# Altium project flight_controller_V1.PrjPcb
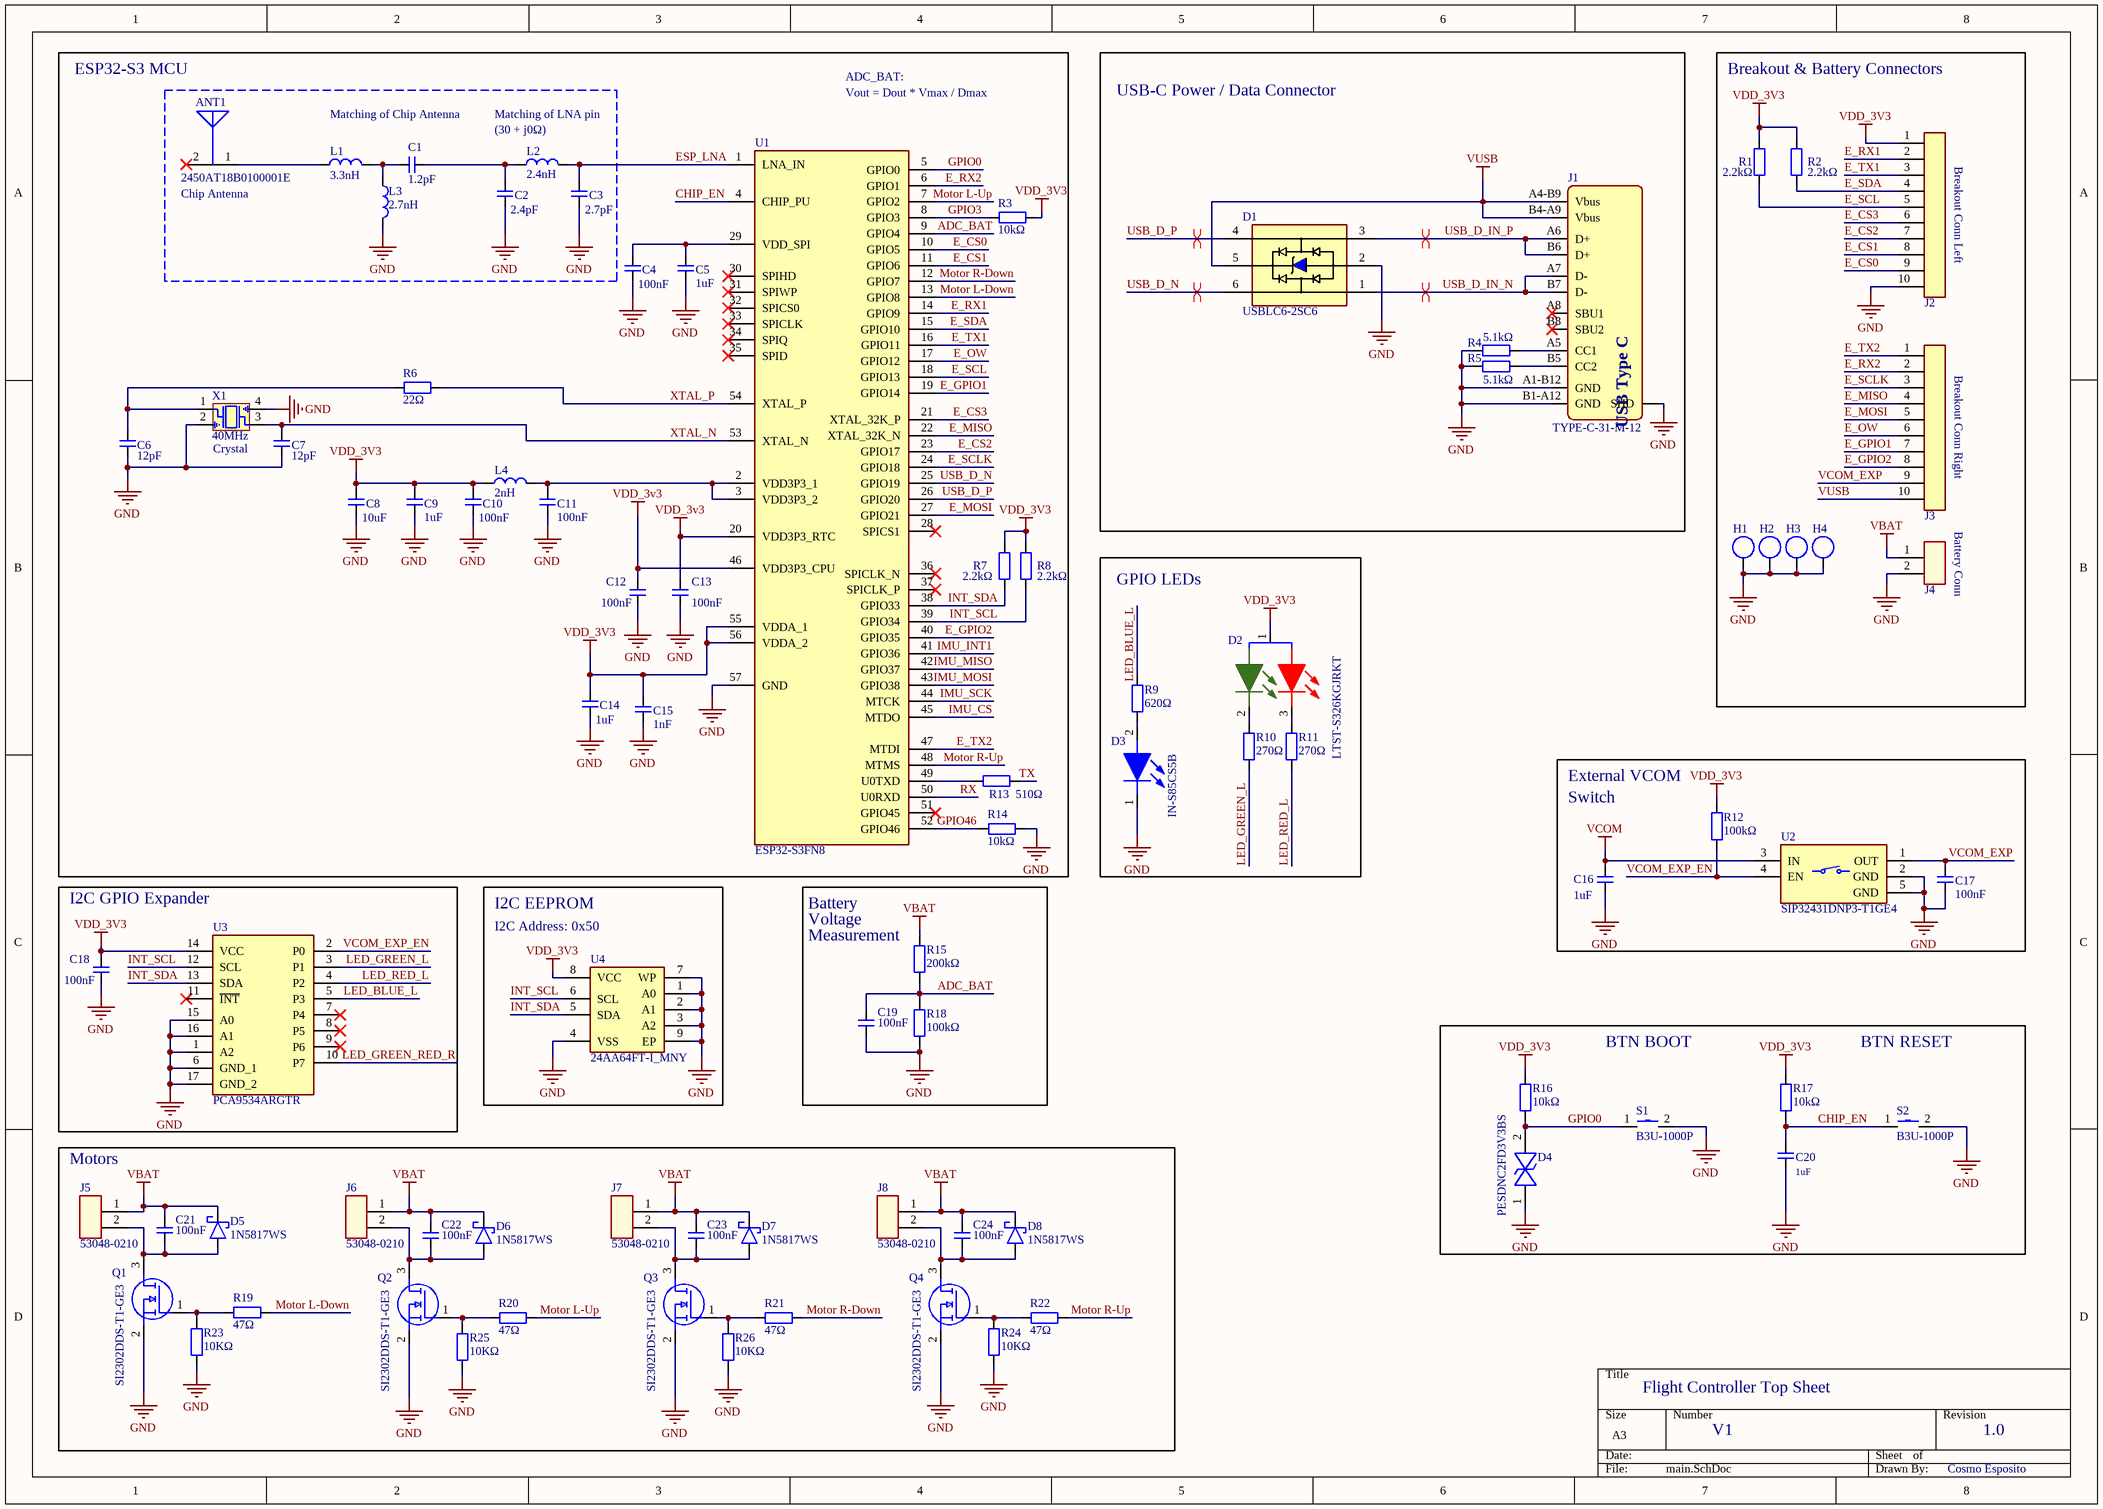
[diagram p0: main.SchDoc]
3 sheets, 115 parts. Net scope: global (net labels, ports and power ports of the same name join across sheets).
Board file: flight_controller.PcbDoc
Sheets:
  main.SchDoc
  sensors.SchDoc
  pm.SchDoc

## Sheet main.SchDoc: Flight Controller Top Sheet
size A3; SheetNumber: 1; SheetTotal: 3

### Parts
ANT1  2450AT18B0100001E  [ANTC3216X140N]
C1  1.2pF  [0402 (1005 metric) CAP IPC-7351 Level B SMD]
C2  2.4pF  [0402 (1005 metric) CAP IPC-7351 Level B SMD]
C3  2.7pF  [0402 (1005 metric) CAP IPC-7351 Level B SMD]
C4  100nF  [0402 (1005 metric) CAP IPC-7351 Level B SMD]
C5  1uF  [0402 (1005 metric) CAP IPC-7351 Level B SMD]
C6  12pF  [0402 (1005 metric) CAP IPC-7351 Level B SMD]
C7  12pF  [0402 (1005 metric) CAP IPC-7351 Level B SMD]
C8  10uF  [0402 (1005 metric) CAP IPC-7351 Level B SMD]
C9  1uF  [0402 (1005 metric) CAP IPC-7351 Level B SMD]
C10  100nF  [0402 (1005 metric) CAP IPC-7351 Level B SMD]
C11  100nF  [0402 (1005 metric) CAP IPC-7351 Level B SMD]
C12  100nF  [0402 (1005 metric) CAP IPC-7351 Level B SMD]
C13  100nF  [0402 (1005 metric) CAP IPC-7351 Level B SMD]
C14  1uF  [0402 (1005 metric) CAP IPC-7351 Level B SMD]
C15  1nF  [0402 (1005 metric) CAP IPC-7351 Level B SMD]
C16  1uF  [0402 (1005 metric) CAP IPC-7351 Level B SMD]
C17  100nF  [0402 (1005 metric) CAP IPC-7351 Level B SMD]
C18  100nF  [0402 (1005 metric) CAP IPC-7351 Level B SMD]
C19  100nF  [0402 (1005 metric) CAP IPC-7351 Level B SMD]
C20  1uF  [0402 (1005 metric) CAP IPC-7351 Level B SMD]
C21  100nF  [0402 (1005 metric) CAP IPC-7351 Level B SMD]
C22  100nF  [0402 (1005 metric) CAP IPC-7351 Level B SMD]
C23  100nF  [0402 (1005 metric) CAP IPC-7351 Level B SMD]
C24  100nF  [0402 (1005 metric) CAP IPC-7351 Level B SMD]
D1  USBLC6-2SC6  [USBLC6-2 SOT-666]
D2  LTST-S326KGJRKT  [LTST-S326KGJRKT]
D3  IN-S85CS5B  [INS85CS5B]
D4  PESDNC2FD3V3BS  [PESDNC2FD3V3BS]
D5  1N5817WS  [SOD2613X110N]
D6  1N5817WS  [SOD2613X110N]
D7  1N5817WS  [SOD2613X110N]
D8  1N5817WS  [SOD2613X110N]
H1  Mounting_Hole  [Plated_Hole]  (value not drawn)
H2  Mounting_Hole  [Plated_Hole]  (value not drawn)
H3  Mounting_Hole  [Plated_Hole]  (value not drawn)
H4  Mounting_Hole  [Plated_Hole]  (value not drawn)
J1  TYPE-C-31-M-12  [USB-C-31-M-12]
J2  1-2307813-0  [123078130]  (value not drawn)
J3  1-2307813-0  [123078130]  (value not drawn)
J4  Battery  [Batt_pads]  (value not drawn)
J5  53048-0210  [53048-0210]
J6  53048-0210  [53048-0210]
J7  53048-0210  [53048-0210]
J8  53048-0210  [53048-0210]
L1  3.3nH  [0402 (1005 metric) IND IPC-7351 Level B SMD_]
L2  2.4nH  [0402 (1005 metric) IND IPC-7351 Level B SMD_]
L3  2.7nH  [0402 (1005 metric) IND IPC-7351 Level B SMD_]
L4  2nH  [0402 (1005 metric) IND IPC-7351 Level B SMD_]
Q1  SI2302DDS-T1-GE3  [SOT95P237X112-3N]
Q2  SI2302DDS-T1-GE3  [SOT95P237X112-3N]
Q3  SI2302DDS-T1-GE3  [SOT95P237X112-3N]
Q4  SI2302DDS-T1-GE3  [SOT95P237X112-3N]
R1  2.2kΩ  [0402 (1005 metric) RES IPC-7351 Level B SMD]
R2  2.2kΩ  [0402 (1005 metric) RES IPC-7351 Level B SMD]
R3  10kΩ  [0402 (1005 metric) RES IPC-7351 Level B SMD]
R4  5.1kΩ  [0402 (1005 metric) RES IPC-7351 Level B SMD]
R5  5.1kΩ  [0402 (1005 metric) RES IPC-7351 Level B SMD]
R6  22Ω  [0402 (1005 metric) RES IPC-7351 Level B SMD]
R7  2.2kΩ  [0402 (1005 metric) RES IPC-7351 Level B SMD]
R8  2.2kΩ  [0402 (1005 metric) RES IPC-7351 Level B SMD]
R9  620Ω  [0402 (1005 metric) RES IPC-7351 Level B SMD]
R10  270Ω  [0402 (1005 metric) RES IPC-7351 Level B SMD]
R11  270Ω  [0402 (1005 metric) RES IPC-7351 Level B SMD]
R12  100kΩ  [0402 (1005 metric) RES IPC-7351 Level B SMD]
R13  510Ω  [0402 (1005 metric) RES IPC-7351 Level B SMD]
R14  10kΩ  [0402 (1005 metric) RES IPC-7351 Level B SMD]
R15  200kΩ  [0402 (1005 metric) RES IPC-7351 Level B SMD]
R16  10kΩ  [0402 (1005 metric) RES IPC-7351 Level B SMD]
R17  10kΩ  [0402 (1005 metric) RES IPC-7351 Level B SMD]
R18  100kΩ  [0402 (1005 metric) RES IPC-7351 Level B SMD]
R19  47Ω  [0402 (1005 metric) RES IPC-7351 Level B SMD]
R20  47Ω  [0402 (1005 metric) RES IPC-7351 Level B SMD]
R21  47Ω  [0402 (1005 metric) RES IPC-7351 Level B SMD]
R22  47Ω  [0402 (1005 metric) RES IPC-7351 Level B SMD]
R23  10KΩ  [0402 (1005 metric) RES IPC-7351 Level B SMD]
R24  10KΩ  [0402 (1005 metric) RES IPC-7351 Level B SMD]
R25  10KΩ  [0402 (1005 metric) RES IPC-7351 Level B SMD]
R26  10KΩ  [0402 (1005 metric) RES IPC-7351 Level B SMD]
S1  B3U-1000P  [B3U-1000P]
S2  B3U-1000P  [B3U-1000P]
U1  ESP32-S3FN8  [ESP32-S3FN8]
U2  SIP32431DNP3-T1GE4  [SON50P160X120X60-5N-D]
U3  PCA9534ARGTR  [QFN50P300X300X100-17N-D]
U4  24AA64FT-I_MNY  [SON50P300X200X80-9N-D]
X1  40MHz  [ECS4001037B2CKMTR]

### Blocks framed on the sheet
ESP32-S3 MCU: ANT1 C1-C15 L1-L4 R3 R6-R8 R13 R14 U1 X1
USB-C Power / Data Connector: D1 J1 R4 R5
Breakout & Battery Connectors: H1-H4 J2-J4 R1 R2
GPIO LEDs: D2 D3 R9-R11
I2C GPIO Expander: C18 U3
I2C EEPROM: U4
Motors: C21-C24 D5-D8 J5-J8 Q1-Q4 R19-R26

### Nets
GND: C2.1 C3.1 C4.1 C5.1 C6.2 C7.2 C8.1 C9.1 C10.1 C11.1 C12.1 C13.1 C14.1 C15.1 C16.1 C17.1 C18.1 C19.1 C20.1 D1.2(GND) D3.1(K) D4.1 H1.1 H2.1 H3.1 H4.1 J1.A1-B12(GND) J1.B1-A12(GND) J1.SHD J2.10 J4.2 L3.1 Q1.2(S) Q2.2(S) Q3.2(S) Q4.2(S) R4.1 R5.1 R14.2 R18.1 R23.1 R24.1 R25.1 R26.1 S1.2 S2.2 U1.57(GND) U2.2(GND) U2.5(GND) U3.1(A2) U3.6(GND_1) U3.15(A0) U3.16(A1) U3.17(GND_2) U4.1(A0) U4.2(A1) U4.3(A2) U4.4(VSS) U4.7(WP) U4.9(EP) X1.2(GND_1) X1.4(GND_2)
VBAT: C21.2 C22.2 C23.2 C24.2 D5.1(K) D6.1(K) D7.1(K) D8.1(K) J4.1 J5.1 J6.1 J7.1 J8.1 R15.2
VCOM: C16.2 U2.3(IN)
VDD_3V3: C8.2 C9.2 C10.2 C12.2 C13.2 C14.2 C15.2 C18.2 D2.1(A) J2.1 L4.1 R1.2 R2.2 R3.2 R7.2 R8.2 R12.2 R16.2 R17.2 U1.20(VDD3P3_RTC) U1.46(VDD3P3_CPU) U1.55(VDDA_1) U1.56(VDDA_2) U3.14(VCC) U4.8(VCC)
VUSB: D1.5(VBUS) J1.A4-B9(Vbus) J1.B4-A9(Vbus) J3.10
ADC_BAT: C19.2 R15.1 R18.2 U1.9(GPIO4)
CHIP_EN: C20.2 R17.1 S2.1 U1.4(CHIP_PU)
E_CS0: J2.9 U1.10(GPIO5)
E_CS1: J2.8 U1.11(GPIO6)
E_CS2: J2.7 U1.23(GPIO17)
E_CS3: J2.6 U1.21(XTAL_32K_P)
E_GPIO1: J3.7 U1.19(GPIO14)
E_GPIO2: J3.8 U1.40(GPIO35)
E_MISO: J3.4 U1.22(XTAL_32K_N)
E_MOSI: J3.5 U1.27(GPIO21)
E_OW: J3.6 U1.17(GPIO12)
E_RX1: J2.2 U1.14(GPIO9)
E_RX2: J3.2 U1.6(GPIO1)
E_SCL: J2.5 R1.1 U1.18(GPIO13)
E_SCLK: J3.3 U1.24(GPIO18)
E_SDA: J2.4 R2.1 U1.15(GPIO10)
E_TX1: J2.3 U1.16(GPIO11)
E_TX2: J3.1 U1.47(MTDI)
ESP_LNA: C3.2 L2.2 U1.1(LNA_IN)
GPIO0: D4.2 R16.1 S1.1 U1.5(GPIO0)
GPIO3: R3.1 U1.8(GPIO3)
GPIO46: R14.1 U1.52(GPIO46)
IMU_CS: U1.45(MTDO)
IMU_INT1: U1.41(GPIO36)
IMU_MISO: U1.42(GPIO37)
IMU_MOSI: U1.43(GPIO38)
IMU_SCK: U1.44(MTCK)
INT_SCL: R8.1 U1.39(GPIO34) U3.12(SCL) U4.6(SCL)
INT_SDA: R7.1 U1.38(GPIO33) U3.13(SDA) U4.5(SDA)
LED_BLUE_L: R9.2 U3.5(P3)
LED_GREEN_L: R10.1 U3.3(P1)
LED_GREEN_RED_R: U3.10(P7)
LED_RED_L: R11.1 U3.4(P2)
Motor L-Down: R19.2 U1.13(GPIO8)
Motor L-Up: R20.2 U1.7(GPIO2)
Motor R-Down: R21.2 U1.12(GPIO7)
Motor R-Up: R22.2 U1.48(MTMS)
RX: U1.50(U0RXD)
TX: R13.2
USB_D_IN_N: D1.1(I/O1_1) J1.A7(D-) J1.B7(D-)
USB_D_IN_P: D1.3(I/O2_1) J1.A6(D+) J1.B6(D+)
USB_D_N: D1.6(I/O1_2) U1.25(GPIO19)
USB_D_P: D1.4(I/O2_2) U1.26(GPIO20)
VCOM_EXP: C17.2 J3.9 U2.1(OUT)
VCOM_EXP_EN: R12.1 U2.4(EN) U3.2(P0)
XTAL_N: C7.1 U1.53(XTAL_N) X1.3(OUT/IN)
XTAL_P: R6.2 U1.54(XTAL_P)
NetANT1_1: ANT1.1(FEED) L1.2
NetC1_1: C1.1 C2.2 L2.1
NetC1_2: C1.2 L1.1 L3.2
NetC4_2: C4.2 C5.2 U1.29(VDD_SPI)
NetC6_1: C6.1 R6.1 X1.1(IN/OUT)
NetC11_2: C11.2 L4.2 U1.2(VDD3P3_1) U1.3(VDD3P3_2)
NetC21_1: C21.1 D5.2(A) J5.2 Q1.3(D)
NetC22_1: C22.1 D6.2(A) J6.2 Q2.3(D)
NetC23_1: C23.1 D7.2(A) J7.2 Q3.3(D)
NetC24_1: C24.1 D8.2(A) J8.2 Q4.3(D)
NetD2_2: D2.2(K) R10.2
NetD2_3: D2.3(K) R11.2
NetD3_2: D3.2(A) R9.1
NetJ1_A5: J1.A5(CC1) R4.2
NetJ1_B5: J1.B5(CC2) R5.2
NetQ1_1: Q1.1(G) R19.1 R23.2
NetQ2_1: Q2.1(G) R20.1 R25.2
NetQ3_1: Q3.1(G) R21.1 R26.2
NetQ4_1: Q4.1(G) R22.1 R24.2
NetR13_1: R13.1 U1.49(U0TXD)

Not connected (* = marked no-connect by the designer): ANT1 2(NC)*; J1 A8(SBU1)* B8(SBU2)*; U1 28(SPICS1)* 30(SPIHD)* 31(SPIWP)* 32(SPICS0)* 33(SPICLK)* 34(SPIQ)* 35(SPID)* 36(SPICLK_N)* 37(SPICLK_P)* 51(GPIO45)*; U3 7(P4)* 8(P5)* 9(P6)* 11(~{INT})*

### Layout directives
differential pair; differential pair class DIFF_USB: USB_D_IN_N, USB_D_IN_P, USB_D_N, USB_D_P

### Notes on the sheet
- ADC_BAT:
- Vout = Dout * Vmax / Dmax
- Matching of Chip Antenna
- (near L2) Matching of LNA pin
- (near L2) (30 + j0Ω)
- (near J2) Breakout Conn Left
- (near ANT1) Chip Antenna
- (near J3) Breakout Conn Right
- Crystal
- Battery Conn
- (near R12) External VCOM
- Switch
- Battery
- Voltage
- (near U4) I2C Address: 0x50
- (near R15) Measurement
- BTN BOOT
- BTN RESET
- Flight Controller Top Sheet
- V1
- 1.0
- Cosmo Esposito
- (in symbol TYPE-C-31-M-12) USB Type C

### Library data of the parts
ANT1 = 2450AT18B0100001E: RF ANTENNA Chip Solder Surface Mount ,2.4GHz ~ 2.5GHz ,2 W; Manufacturer_Name: JOHANSON TECHNOLOGY; Geometry.Height: 1.4mm; Mouser Part Number: *; Mouser Price/Stock: *; Manufacturer_Part_Number: 2450AT18B0100001E; Datasheet Link: https://www.johansontechnology.com/docs/3829/Antenna-2450AT18B0100001E-Rev5.0_uMmswfC.pdf
C1-C24 = Capacitor Type1
  C1: Value: 1.2pF
  C2: Value: 2.4pF
  C3: Value: 2.7pF
  C4 C10-C13 C17-C19 C21-C24: Value: 100nF
  C5 C9 C14 C16 C20: Value: 1uF
  C6 C7: Value: 12pF
  C8: Value: 10uF
  C15: Value: 1nF
D1 = USBLC6-2SC6: TVS Diode Array Uni-Directional USBLC6-2SC6 17V, SOT-23 6-Pin; Manufacturer_Name: STMicroelectronics; Geometry.Height: 1.45mm; Mouser Part Number: 511-USBLC6-2SC6; Mouser Price/Stock: https://www.mouser.co.uk/ProductDetail/STMicroelectronics/USBLC6-2SC6?qs=po45yt2pPpu%2FhNIlwQdTlg%3D%3D; Manufacturer_Part_Number: USBLC6-2SC6; Datasheet Link: https://www.st.com/resource/en/datasheet/usblc6-2.pdf
D2 = LTST-S326KGJRKT: Red / Green standard LED; Manufacturer_Name: Lite-On; Datasheet Link: http://optoelectronics.liteon.com/upload/download/DS22-2000-287/LTST-S326KGJRKT.pdf; Manufacturer_Part_Number: LTST-S326KGJRKT; Mouser Part Number: 859-LTST-S326KGJRKT; Mouser Price/Stock: https://www.mouser.co.uk/ProductDetail/Lite-On/LTST-S326KGJRKT?qs=sXYjIdLHthxXAK%252B5bY%252BGww%3D%3D; Arrow Part Number: LTST-S326KGJRKT; Arrow Price/Stock: https://www.arrow.com/en/products/ltst-s326kgjrkt/lite-on-technology.html?utm_currency=USD&region=nac
D3 = IN-S85CS5B: Standard LEDs - SMD Blue LED; Manufacturer_Name: Inolux; Geometry.Height: 0.7mm; Mouser Part Number: 743-IN-S85CS5B; Mouser Price/Stock: https://www.mouser.co.uk/ProductDetail/Inolux/IN-S85CS5B?qs=stqOd1AaK79rJ2RZKPoGSg%3D%3D; Manufacturer_Part_Number: IN-S85CS5B; Datasheet Link: https://www.inolux-corp.com/datasheet/SMDLED/Mono%20Color%20Side%20View/IN-S85CS5B_V1.0.pdf
D4 = PESDNC2FD3V3BS: Bottom ViewEM/CM/EMS Only; Manufacturer_Name: Prisemi; Geometry.Height: 0.498mm; Manufacturer_Part_Number: PESDNC2FD3V3BS; Mouser Part Number: *; Mouser Price/Stock: *; Arrow Part Number: *; Arrow Price/Stock: *; Datasheet Link: https://datasheet.lcsc.com/lcsc/2003172139_Shanghai-Prisemi-Elec-PESDNC2FD3V3BS_C496536.pdf
D5-D8 = 1N5817WS: Diode 20V 1A Surface Mount SOD-323; Manufacturer_Name: Guandong AK Semiconductor; Geometry.Height: 1.1mm; Manufacturer_Part_Number: 1N5817WS; Mouser Part Number: *; Mouser Price/Stock: *; Arrow Part Number: *; Arrow Price/Stock: *; Datasheet Link: https://atlas.eefcdn.com/partdatasheet/666677/666677_35638466_1757293714069.pdf
J1 = TYPE-C-31-M-12: Description; Manufacturer_Name: HRO Electronics; Copyright: Copyright (C) 2025 Ultra Librarian. All rights reserved.; Manufacturer_Part_Number: TYPE-C-31-M-12; RefDes: RefDes; Type: Type
J2 J3 = 1-2307813-0: Board to Board & Mezzanine Connectors 10P,2MM,BB,REC,SRVT,SMD,0.1AU,TR,W/CP
J4 = Battery_conn
J5-J8 = 53048-0210: 1.25mm Pitch, PicoBlade PCB Header, Single Row, Right-Angle, Surface Mount, Tin (Sn) Plating, Friction Lock, 2 Circuits, Natural, Tape and Reel; Manufacturer_Name: Molex Connector Corporation; Copyright: Copyright (C) 2025 Ultra Librarian. All rights reserved.; Manufacturer_Part_Number: 53048-0210; RefDes: RefDes; Type: Type
L1-L4 = Inductor Type1
  L1: Value: 3.3nH
  L2: Value: 2.4nH
  L3: Value: 2.7nH
  L4: Value: 2nH
Q1-Q4 = SI2302DDS-T1-GE3: SI2302DDS-T1-GE3 N-Channel MOSFET, 2.6 A, 20 V, 3-Pin SOT-363 Vishay; Geometry.Height: 1.12mm; Mouser Part Number: 78-SI2302DDS-T1-GE3; Mouser Price/Stock: https://www.mouser.co.uk/ProductDetail/Vishay-Semiconductors/SI2302DDS-T1-GE3?qs=MxnWX8BLHKdaCSNWhg%252BxLA%3D%3D; Manufacturer_Name: Vishay; Manufacturer_Part_Number: SI2302DDS-T1-GE3; Datasheet Link: http://www.vishay.com/docs/63653/si2302dds.pdf
R1-R26 = Resistor Type1
  R1 R2 R7 R8: Value: 2.2kΩ
  R3 R14 R16 R17: Value: 10kΩ
  R4 R5: Value: 5.1kΩ
  R6: Value: 22Ω
  R9: Value: 620Ω
  R10 R11: Value: 270Ω
  R12 R18: Value: 100kΩ
  R13: Value: 510Ω
  R15: Value: 200kΩ
  R19-R22: Value: 47Ω
  R23-R26: Value: 10KΩ
S1 S2 = B3U-1000P: Switch; Manufacturer_Name: OMRON Electronics; Datasheet Link: https://www.omron.com/ecb/products/pdf/en-b3u.pdf; Manufacturer_Part_Number: B3U-1000P; Mouser Part Number: 653-B3U-1000P; Mouser Price/Stock: https://www.mouser.co.uk/ProductDetail/Omron-Electronics/B3U-1000P?qs=AO7BQMcsEu4ip80xyf2FwA%3D%3D; Arrow Part Number: B3U-1000P; Arrow Price/Stock: https://www.arrow.com/en/products/b3u1000p/omron.html?utm_currency=USD&region=nac
U1 = ESP32-S3FN8: Espressif Systems [ENGINEERING SAMPLES]SMD IC , Dual-Core MCU, Wi-Fi 2.4G & BLE 5.0 combo, 8 MB Octal SPI PSRAM; Geometry.Height: 0.9mm; Manufacturer_Name: Espressif Systems; Manufacturer_Part_Number: ESP32-S3FN8; Mouser Part Number: 356-ESP32-S3FN8; Mouser Price/Stock: https://www.mouser.co.uk/ProductDetail/Espressif-Systems/ESP32-S3FN8?qs=Rp5uXu7WBW%2F4Oihh5tkiVQ%3D%3D; Arrow Part Number: *; Arrow Price/Stock: *; Datasheet Link: https://www.espressif.com/sites/default/files/documentation/esp32-s3_datasheet_en.pdf
U2 = SIP32431DNP3-T1GE4: Power Switch ICs - Power Distribution 1A Slew Rate Ctrl Load Switch; Manufacturer_Name: Vishay; Geometry.Height: 0.6mm; Manufacturer_Part_Number: SIP32431DNP3-T1GE4; Mouser Part Number: 781-SIP32431DNP3-GE4; Mouser Price/Stock: https://www.mouser.co.uk/ProductDetail/Vishay-Semiconductors/SIP32431DNP3-T1GE4?qs=FfLXECYddQQ0YorCqBSrEw%3D%3D; Arrow Part Number: SIP32431DNP3-T1GE4; Arrow Price/Stock: https://www.arrow.com/en/products/sip32431dnp3-t1ge4/vishay?utm_currency=USD&region=nac; Datasheet Link: https://www.vishay.com/docs/66597/sip32431.pdf
U3 = PCA9534ARGTR: Remote 8-Bit I2C and Low-Power I/O Expander With Interrupt Output and Configuration Registers; Manufacturer_Name: Texas Instruments; Geometry.Height: 1mm; Mouser Part Number: 595-PCA9534ARGTR; Mouser Price/Stock: https://www.mouser.co.uk/ProductDetail/Texas-Instruments/PCA9534ARGTR?qs=iSMark9AYDXZsmImREj9BA%3D%3D; Manufacturer_Part_Number: PCA9534ARGTR; Datasheet Link: http://www.ti.com/lit/ds/symlink/pca9534a.pdf
U4 = 24AA64FT-I_MNY: EEPROM 64K 8KX8 1.8V SER EE IND 1/4AWP RPO; Manufacturer_Name: Microchip; Manufacturer_Part_Number: 24AA64FT-I/MNY; Geometry.Height: 0.8mm; Mouser Part Number: 579-24AA64FT-I/MNY; Mouser Price/Stock: https://www.mouser.co.uk/ProductDetail/Microchip-Technology/24AA64FT-I-MNY?qs=WqWCsLCZBkpYIYo7OoCm1g%3D%3D; Datasheet Link: http://www.microchip.com/mymicrochip/filehandler.aspx?ddocname=en541451
X1 = ECS-400-10-37B2-CKM-TR: 40 MHz +/-10ppm Crystal 10pF 40 Ohms 4-SMD, No Lead , -20C ~ 70C; Manufacturer_Name: ECS; Geometry.Height: 0.5mm; Mouser Part Number: 520-400-10-37B2CKMTR; Mouser Price/Stock: https://www.mouser.co.uk/ProductDetail/ECS/ECS-400-10-37B2-CKM-TR?qs=QNEnbhJQKvYTTE6TC4Pr1w%3D%3D; Manufacturer_Part_Number: ECS-400-10-37B2-CKM-TR; Datasheet Link: https://ecsxtal.com/store/pdf/ECX-1637B2.pdf

## Sheet sensors.SchDoc
size A4; SheetNumber: 2; SheetTotal: 3
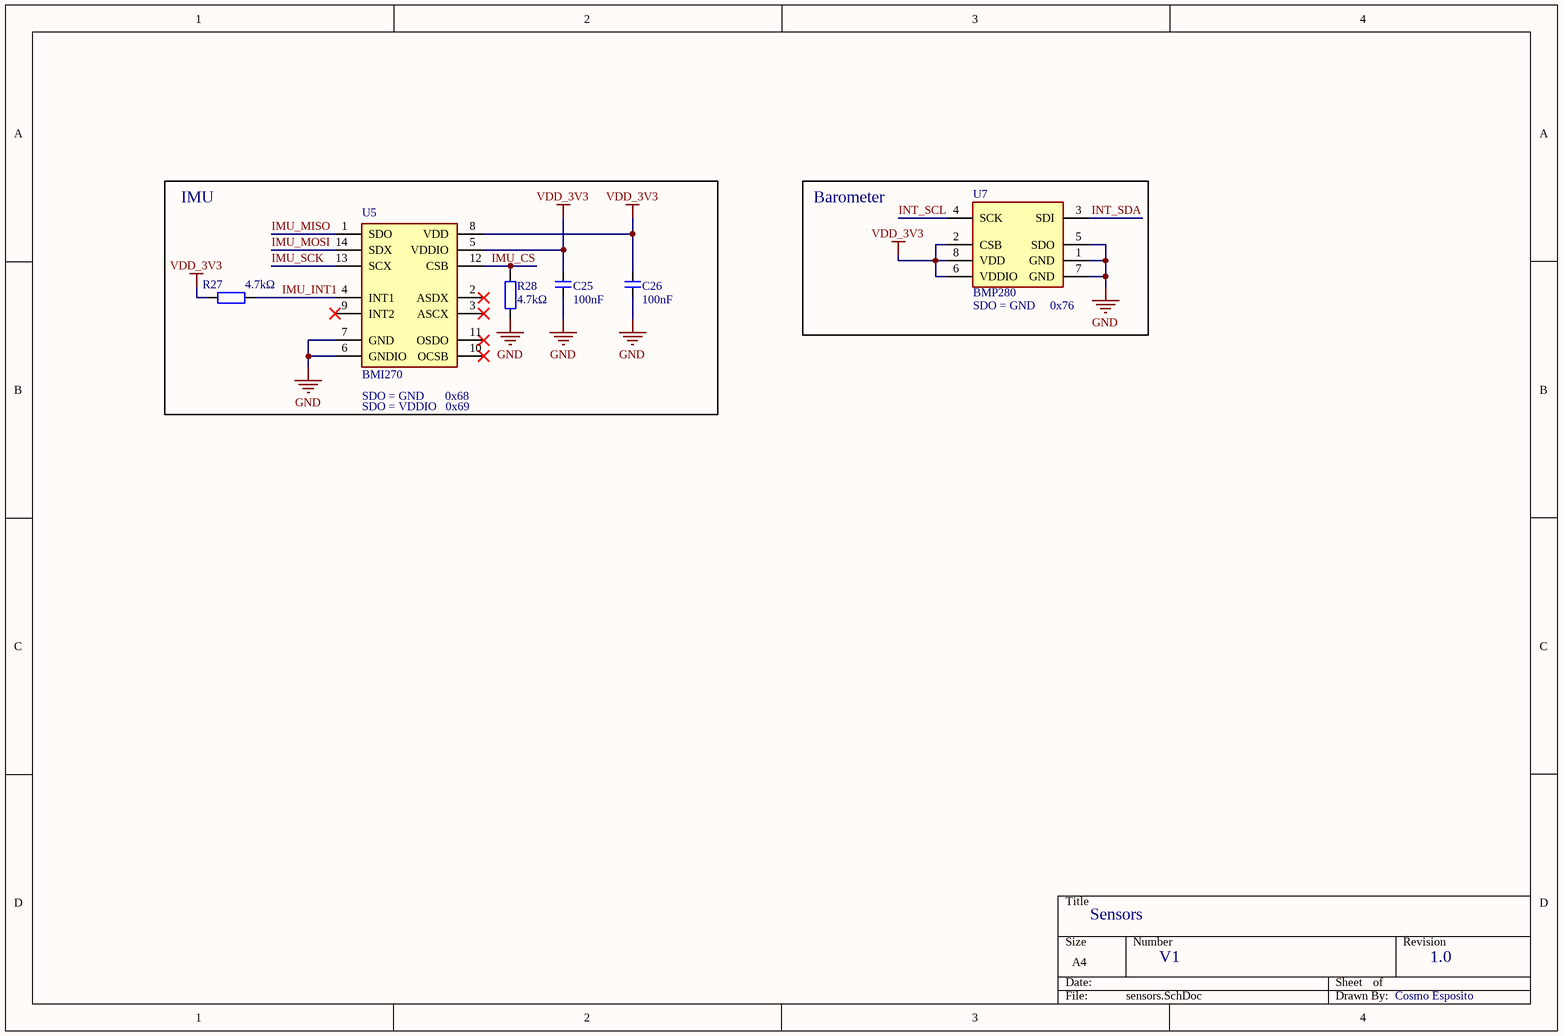
[diagram p1: sensors.SchDoc]

### Parts
C25  100nF  [0402 (1005 metric) CAP IPC-7351 Level B SMD]
C26  100nF  [0402 (1005 metric) CAP IPC-7351 Level B SMD]
R27  4.7kΩ  [0402 (1005 metric) RES IPC-7351 Level B SMD]
R28  4.7kΩ  [0402 (1005 metric) RES IPC-7351 Level B SMD]
U5  BMI270  [BMI270]
U7  BMP280  [BMP280]

### Blocks framed on the sheet
IMU: C25 C26 R27 R28 U5
Barometer: U7

### Nets
GND: C25.1 C26.1 R28.1 U5.6(GNDIO) U5.7(GND) U7.1(GND) U7.5(SDO) U7.7(GND)
VDD_3V3: C25.2 C26.2 R27.2 U5.5(VDDIO) U5.8(VDD) U7.2(CSB) U7.6(VDDIO) U7.8(VDD)
IMU_CS: R28.2 U5.12(CSB)
IMU_INT1: R27.1 U5.4(INT1)
IMU_MISO: U5.1(SDO)
IMU_MOSI: U5.14(SDX)
IMU_SCK: U5.13(SCX)
INT_SCL: U7.4(SCK)
INT_SDA: U7.3(SDI)

Not connected (* = marked no-connect by the designer): U5 2(ASDX)* 3(ASCX)* 9(INT2)* 10(OCSB)* 11(OSDO)*

### Notes on the sheet
- (near U7) SDO = GND     0x76
- (near U5) SDO = GND       0x68
- (near U5) SDO = VDDIO   0x69
- Sensors
- V1
- 1.0
- Cosmo Esposito

### Library data of the parts
C25 C26 = Capacitor Type1: Value: 100nF
R27 R28 = Resistor Type1: Value: 4.7kΩ
U5 = BMI270: IMUs - Inertial Measurement Units Smart Ultra-Low Power Inertial Measurement Unit (IMU) for Wearable Applications; Manufacturer_Name: BOSCH; Geometry.Height: 0.87mm; Manufacturer_Part_Number: BMI270; Mouser Part Number: 262-BMI270; Mouser Price/Stock: https://www.mouser.co.uk/ProductDetail/Bosch-Sensortec/BMI270?qs=u16ybLDytRYIj%252BjQEee88A%3D%3D; Arrow Part Number: BMI270; Arrow Price/Stock: https://www.arrow.com/en/products/bmi270/bosch-sensortec?utm_currency=USD&region=europe; Datasheet Link: https://www.bosch-sensortec.com/media/boschsensortec/downloads/datasheets/bst-bmi270-ds000.pdf
U7 = BMP280: IC; SNSR; DIGITAL; BAROMETRIC PRESSURE SENSOR; LGA8; Manufacturer_Name: Bosch Sensortec; Copyright: Copyright (C) 2026 Ultra Librarian. All rights reserved.; Manufacturer_Part_Number: BMP280; RefDes: RefDes; Type: Type

## Sheet pm.SchDoc
size A4; SheetNumber: 3; SheetTotal: 3
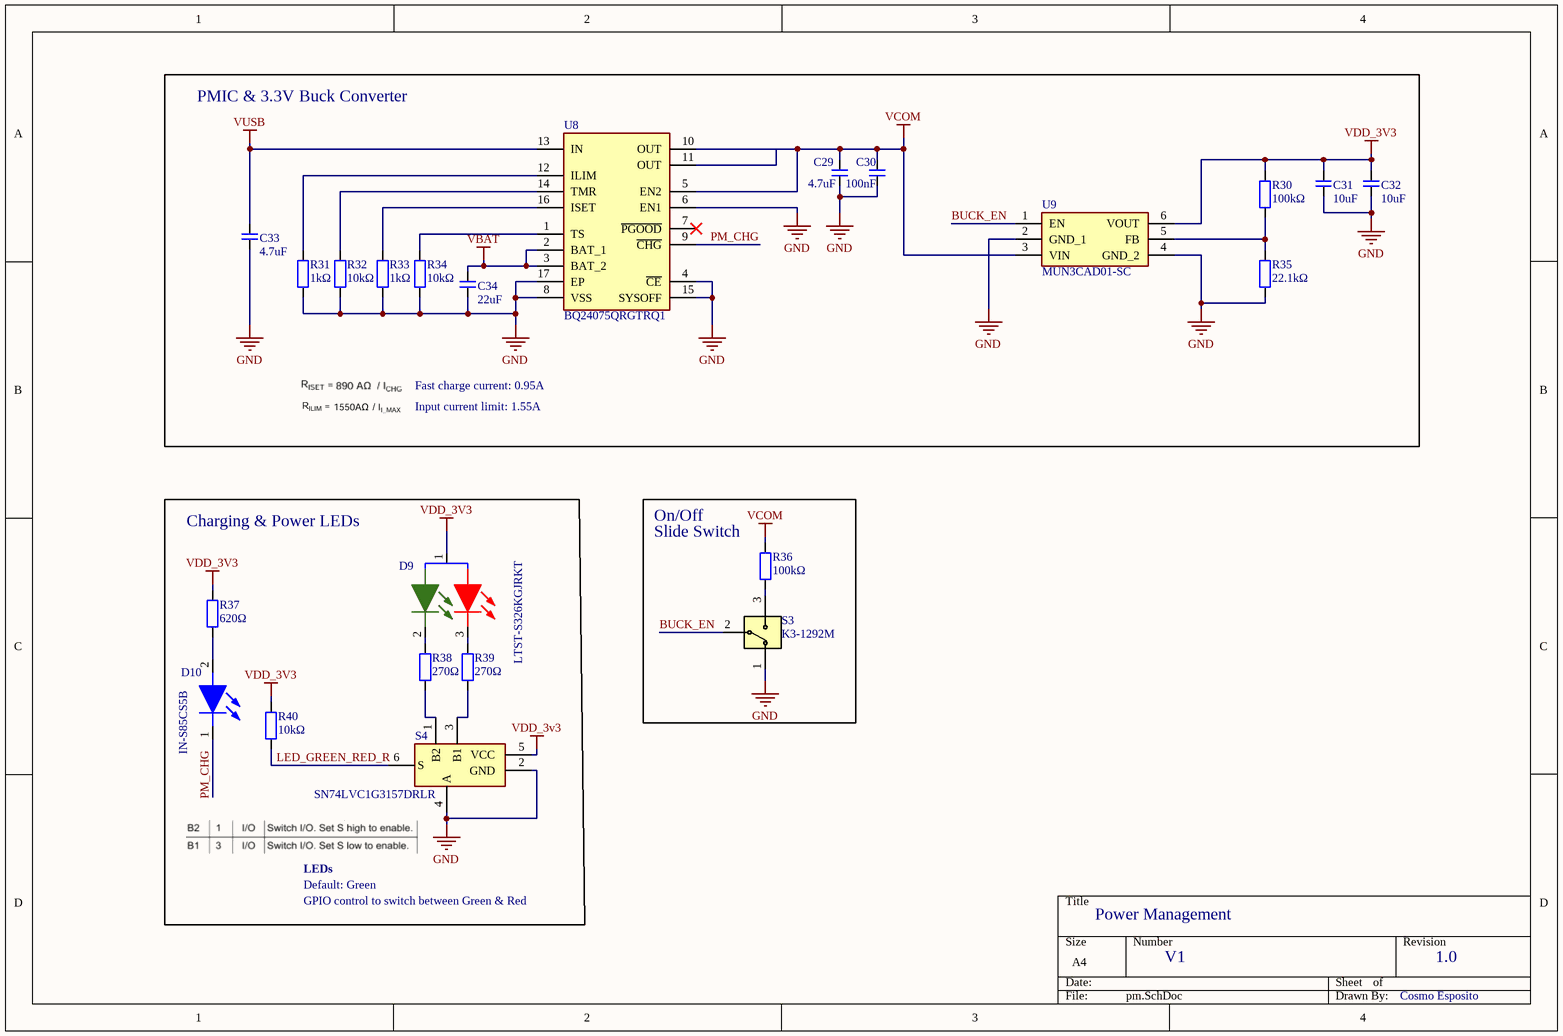
[diagram p2: pm.SchDoc]

### Parts
C29  4.7uF  [0402 (1005 metric) CAP IPC-7351 Level B SMD]
C30  100nF  [0402 (1005 metric) CAP IPC-7351 Level B SMD]
C31  10uF  [0402 (1005 metric) CAP IPC-7351 Level B SMD]
C32  10uF  [0402 (1005 metric) CAP IPC-7351 Level B SMD]
C33  4.7uF  [0603 (1608 metric) CAP IPC-7351 Level B SMD]
C34  22uF  [0603 (1608 metric) CAP IPC-7351 Level B SMD]
D9  LTST-S326KGJRKT  [LTST-S326KGJRKT]
D10  IN-S85CS5B  [INS85CS5B]
R30  100kΩ  [0402 (1005 metric) RES IPC-7351 Level B SMD]
R31  1kΩ  [0402 (1005 metric) RES IPC-7351 Level B SMD]
R32  10kΩ  [0402 (1005 metric) RES IPC-7351 Level B SMD]
R33  1kΩ  [0402 (1005 metric) RES IPC-7351 Level B SMD]
R34  10kΩ  [0402 (1005 metric) RES IPC-7351 Level B SMD]
R35  22.1kΩ  [0402 (1005 metric) RES IPC-7351 Level B SMD]
R36  100kΩ  [0402 (1005 metric) RES IPC-7351 Level B SMD]
R37  620Ω  [0402 (1005 metric) RES IPC-7351 Level B SMD]
R38  270Ω  [0402 (1005 metric) RES IPC-7351 Level B SMD]
R39  270Ω  [0402 (1005 metric) RES IPC-7351 Level B SMD]
R40  10kΩ  [0402 (1005 metric) RES IPC-7351 Level B SMD]
S3  K3-1292M  [K3-1292M]
S4  SN74LVC1G3157DRLR  [SOTFL50P160X60-6N]
U8  BQ24075QRGTRQ1  [QFN50P300X300X100-17N-D]
U9  MUN3CAD01-SC  [MUN3CAD01SC]

### Blocks framed on the sheet
PMIC & 3.3V Buck Converter: C29-C34 R30-R35 U8 U9
Charging & Power LEDs: D9 D10 R37-R40 S4

### Nets
GND: C29.1 C30.1 C31.1 C32.1 C33.1 C34.1 R31.2 R32.2 R33.2 R34.2 R35.2 S3.1 S4.2(GND) S4.4(A) U8.4(~{CE}) U8.6(EN1) U8.8(VSS) U8.15(SYSOFF) U8.17(EP) U9.2(GND_1) U9.4(GND_2)
VBAT: C34.2 U8.2(BAT_1) U8.3(BAT_2)
VCOM: C29.2 C30.2 R36.2 U8.5(EN2) U8.10(OUT) U8.11(OUT) U9.3(VIN)
VDD_3V3: C31.2 C32.2 D9.1(A) R30.1 R37.2 R40.1 S4.5(VCC) U9.6(VOUT)
VUSB: C33.2 U8.13(IN)
BUCK_EN: S3.2 U9.1(EN)
LED_GREEN_RED_R: R40.2 S4.6(S)
PM_CHG: D10.1(K) U8.9(~{CHG})
NetD9_2: D9.2(K) R38.2
NetD9_3: D9.3(K) R39.2
NetD10_2: D10.2(A) R37.1
NetR30_2: R30.2 R35.1 U9.5(FB)
NetR31_1: R31.1 U8.12(ILIM)
NetR32_1: R32.1 U8.14(TMR)
NetR33_1: R33.1 U8.16(ISET)
NetR34_1: R34.1 U8.1(TS)
NetR36_1: R36.1 S3.3
NetR38_1: R38.1 S4.1(B2)
NetR39_1: R39.1 S4.3(B1)

Not connected (* = marked no-connect by the designer): U8 7(~{PGOOD})*

### Notes on the sheet
- Input current limit: 1.55A
- Fast charge current: 0.95A
- On/Off
- (near R36) Slide Switch
- Default: Green
- GPIO control to switch between Green & Red
- LEDs
- Power Management
- V1
- 1.0
- Cosmo Esposito

### Library data of the parts
C29-C34 = Capacitor Type1
  C29 C33: Value: 4.7uF
  C30: Value: 100nF
  C31 C32: Value: 10uF
  C34: Value: 22uF
D9 = LTST-S326KGJRKT: as D2 on sheet main; Datasheet Link: http://optoelectronics.liteon.com/upload/download/DS22-2000-287/LTST-S326KGJRKT.pdf; Manufacturer_Part_Number: LTST-S326KGJRKT; Mouser Part Number: 859-LTST-S326KGJRKT; Mouser Price/Stock: https://www.mouser.co.uk/ProductDetail/Lite-On/LTST-S326KGJRKT?qs=sXYjIdLHthxXAK%252B5bY%252BGww%3D%3D; Arrow Part Number: LTST-S326KGJRKT; Arrow Price/Stock: https://www.arrow.com/en/products/ltst-s326kgjrkt/lite-on-technology.html?utm_currency=USD&region=nac
D10 = IN-S85CS5B: as D3 on sheet main; Mouser Part Number: 743-IN-S85CS5B; Mouser Price/Stock: https://www.mouser.co.uk/ProductDetail/Inolux/IN-S85CS5B?qs=stqOd1AaK79rJ2RZKPoGSg%3D%3D; Manufacturer_Part_Number: IN-S85CS5B; Datasheet Link: https://www.inolux-corp.com/datasheet/SMDLED/Mono%20Color%20Side%20View/IN-S85CS5B_V1.0.pdf
R30-R40 = Resistor Type1
  R30 R36: Value: 100kΩ
  R31 R33: Value: 1kΩ
  R32 R34 R40: Value: 10kΩ
  R35: Value: 22.1kΩ
  R37: Value: 620Ω
  R38 R39: Value: 270Ω
S3 = K3-1292M: Toggle Switches 5*2.75mm RoHS; Manufacturer_Name: Korean Hroparts Elec; Geometry.Height: 1.4mm; Manufacturer_Part_Number: K3-1292M; Mouser Part Number: *; Mouser Price/Stock: *; Arrow Part Number: *; Arrow Price/Stock: *; Datasheet Link: https://datasheet.lcsc.com/szlcsc/Korean-Hroparts-Elec-K3-1293S-E2_C145852.pdf
S4 = SN74LVC1G3157DRLR: Single-Pole, Double-Throw Analog Switch; Manufacturer_Name: Texas Instruments; Geometry.Height: 0.6mm; Mouser Part Number: 595-SN74LVC1G3157DRL; Mouser Price/Stock: https://www.mouser.co.uk/ProductDetail/Texas-Instruments/SN74LVC1G3157DRLR?qs=PVVDbbWpW3LmfSj83Os0NA%3D%3D; Manufacturer_Part_Number: SN74LVC1G3157DRLR; Datasheet Link: http://www.ti.com/lit/gpn/sn74lvc1g3157
U8 = BQ24075QRGTRQ1: Automotive 4.35V to 16V, 1.5A Li-Ion Charger with Power-Path Management for 5.5V Systems; Manufacturer_Name: Texas Instruments; Geometry.Height: 1mm; Mouser Part Number: 595-BQ24075QRGTRQ1; Mouser Price/Stock: https://www.mouser.co.uk/ProductDetail/Texas-Instruments/BQ24075QRGTRQ1?qs=i8JZjLRTtkLLeOPMlhTMpg%3D%3D; Manufacturer_Part_Number: BQ24075QRGTRQ1; Datasheet Link: http://www.ti.com/lit/gpn/bq24075-q1
U9 = MUN3CAD01-SC: DC DC CONVERTER 0.8-4V; Manufacturer_Name: Delta Electronics; Geometry.Height: 1.05mm; Manufacturer_Part_Number: MUN3CAD01-SC; Mouser Part Number: 108-MUN3CAD01-SC; Mouser Price/Stock: https://www.mouser.co.uk/ProductDetail/Delta-Electronics/MUN3CAD01-SC?qs=t7xnP681wgVWBGFjFLJIqQ%3D%3D; Arrow Part Number: *; Arrow Price/Stock: *; Datasheet Link: https://www.cyntec.com/upfile/products/download/Cyntec%20MUN3CAD01-SC_Datasheet%2007.pdf

## Nets that join several sheets
GND: main (62 pins), sensors (8 pins), pm (21 pins)
VBAT: main (14 pins), pm (C34.2 U8.2 U8.3)
VCOM: main (C16.2 U2.3), pm (7 pins)
VDD_3V3: main (25 pins), sensors (8 pins), pm (8 pins)
VUSB: main (D1.5 J1.A4-B9 J1.B4-A9 J3.10), pm (C33.2 U8.13)
IMU_CS: main (U1.45), sensors (R28.2 U5.12)
IMU_INT1: main (U1.41), sensors (R27.1 U5.4)
IMU_MISO: main (U1.42), sensors (U5.1)
IMU_MOSI: main (U1.43), sensors (U5.14)
IMU_SCK: main (U1.44), sensors (U5.13)
INT_SCL: main (R8.1 U1.39 U3.12 U4.6), sensors (U7.4)
INT_SDA: main (R7.1 U1.38 U3.13 U4.5), sensors (U7.3)
LED_GREEN_RED_R: main (U3.10), pm (R40.2 S4.6)